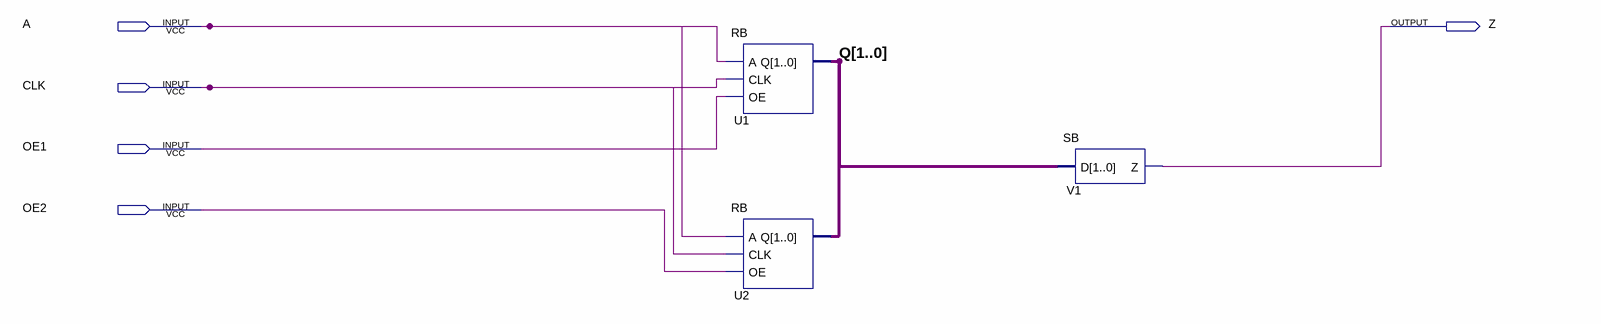
[diagram p0: schematic sheet]
// Quartus schematic BUSV.bdf as structural Verilog: 3 symbols, 5 pins
module BUSV (
  input  A,
  input  CLK,
  input  OE1,
  input  OE2,
  output Z
);

  wire [1:0] Q;

  RB U1 (.A(A), .CLK(CLK), .OE(OE1), .Q(Q));
  RB U2 (.A(A), .CLK(CLK), .OE(OE2), .Q(Q));
  SB V1 (.D(Q), .Z(Z));
endmodule
